# Altium schematic sheet Keyboard.SchDoc
size C
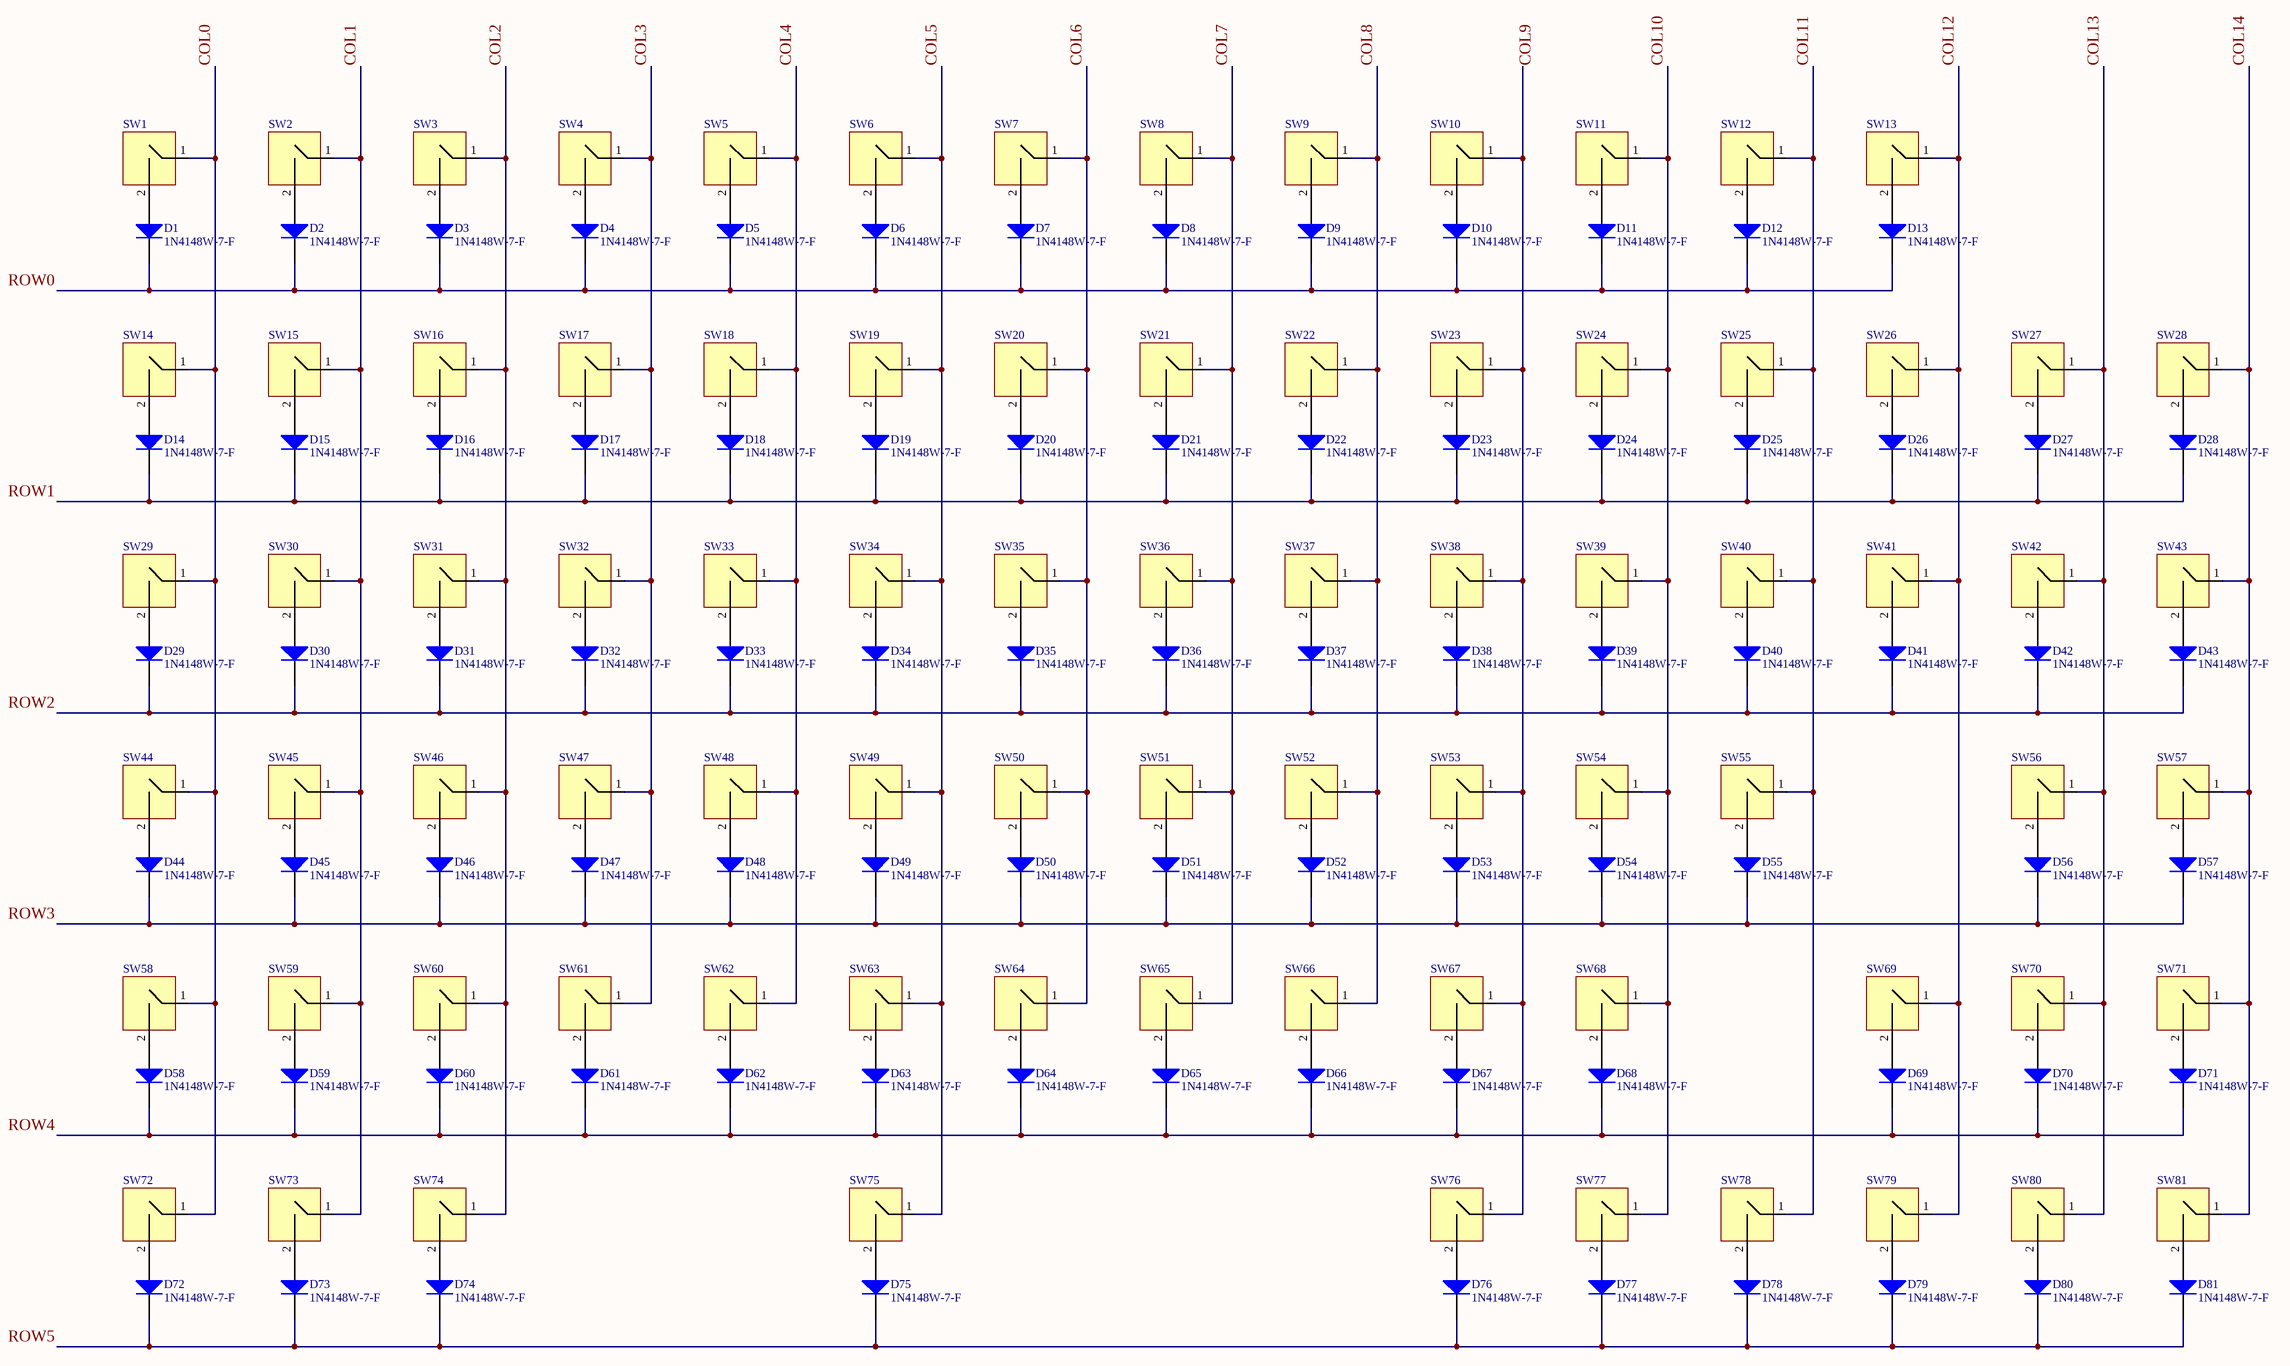
[diagram p0: Keyboard.SchDoc]

## Parts
D1  1N4148W-7-F  [DIOD-SOD123-2_V]
D2  1N4148W-7-F  [DIOD-SOD123-2_V]
D3  1N4148W-7-F  [DIOD-SOD123-2_V]
D4  1N4148W-7-F  [DIOD-SOD123-2_V]
D5  1N4148W-7-F  [DIOD-SOD123-2_V]
D6  1N4148W-7-F  [DIOD-SOD123-2_V]
D7  1N4148W-7-F  [DIOD-SOD123-2_V]
D8  1N4148W-7-F  [DIOD-SOD123-2_V]
D9  1N4148W-7-F  [DIOD-SOD123-2_V]
D10  1N4148W-7-F  [DIOD-SOD123-2_V]
D11  1N4148W-7-F  [DIOD-SOD123-2_V]
D12  1N4148W-7-F  [DIOD-SOD123-2_V]
D13  1N4148W-7-F  [DIOD-SOD123-2_V]
D14  1N4148W-7-F  [DIOD-SOD123-2_V]
D15  1N4148W-7-F  [DIOD-SOD123-2_V]
D16  1N4148W-7-F  [DIOD-SOD123-2_V]
D17  1N4148W-7-F  [DIOD-SOD123-2_V]
D18  1N4148W-7-F  [DIOD-SOD123-2_V]
D19  1N4148W-7-F  [DIOD-SOD123-2_V]
D20  1N4148W-7-F  [DIOD-SOD123-2_V]
D21  1N4148W-7-F  [DIOD-SOD123-2_V]
D22  1N4148W-7-F  [DIOD-SOD123-2_V]
D23  1N4148W-7-F  [DIOD-SOD123-2_V]
D24  1N4148W-7-F  [DIOD-SOD123-2_V]
D25  1N4148W-7-F  [DIOD-SOD123-2_V]
D26  1N4148W-7-F  [DIOD-SOD123-2_V]
D27  1N4148W-7-F  [DIOD-SOD123-2_V]
D28  1N4148W-7-F  [DIOD-SOD123-2_V]
D29  1N4148W-7-F  [DIOD-SOD123-2_V]
D30  1N4148W-7-F  [DIOD-SOD123-2_V]
D31  1N4148W-7-F  [DIOD-SOD123-2_V]
D32  1N4148W-7-F  [DIOD-SOD123-2_V]
D33  1N4148W-7-F  [DIOD-SOD123-2_V]
D34  1N4148W-7-F  [DIOD-SOD123-2_V]
D35  1N4148W-7-F  [DIOD-SOD123-2_V]
D36  1N4148W-7-F  [DIOD-SOD123-2_V]
D37  1N4148W-7-F  [DIOD-SOD123-2_V]
D38  1N4148W-7-F  [DIOD-SOD123-2_V]
D39  1N4148W-7-F  [DIOD-SOD123-2_V]
D40  1N4148W-7-F  [DIOD-SOD123-2_V]
D41  1N4148W-7-F  [DIOD-SOD123-2_V]
D42  1N4148W-7-F  [DIOD-SOD123-2_V]
D43  1N4148W-7-F  [DIOD-SOD123-2_V]
D44  1N4148W-7-F  [DIOD-SOD123-2_V]
D45  1N4148W-7-F  [DIOD-SOD123-2_V]
D46  1N4148W-7-F  [DIOD-SOD123-2_V]
D47  1N4148W-7-F  [DIOD-SOD123-2_V]
D48  1N4148W-7-F  [DIOD-SOD123-2_V]
D49  1N4148W-7-F  [DIOD-SOD123-2_V]
D50  1N4148W-7-F  [DIOD-SOD123-2_V]
D51  1N4148W-7-F  [DIOD-SOD123-2_V]
D52  1N4148W-7-F  [DIOD-SOD123-2_V]
D53  1N4148W-7-F  [DIOD-SOD123-2_V]
D54  1N4148W-7-F  [DIOD-SOD123-2_V]
D55  1N4148W-7-F  [DIOD-SOD123-2_V]
D56  1N4148W-7-F  [DIOD-SOD123-2_V]
D57  1N4148W-7-F  [DIOD-SOD123-2_V]
D58  1N4148W-7-F  [DIOD-SOD123-2_V]
D59  1N4148W-7-F  [DIOD-SOD123-2_V]
D60  1N4148W-7-F  [DIOD-SOD123-2_V]
D61  1N4148W-7-F  [DIOD-SOD123-2_V]
D62  1N4148W-7-F  [DIOD-SOD123-2_V]
D63  1N4148W-7-F  [DIOD-SOD123-2_V]
D64  1N4148W-7-F  [DIOD-SOD123-2_V]
D65  1N4148W-7-F  [DIOD-SOD123-2_V]
D66  1N4148W-7-F  [DIOD-SOD123-2_V]
D67  1N4148W-7-F  [DIOD-SOD123-2_V]
D68  1N4148W-7-F  [DIOD-SOD123-2_V]
D69  1N4148W-7-F  [DIOD-SOD123-2_V]
D70  1N4148W-7-F  [DIOD-SOD123-2_V]
D71  1N4148W-7-F  [DIOD-SOD123-2_V]
D72  1N4148W-7-F  [DIOD-SOD123-2_V]
D73  1N4148W-7-F  [DIOD-SOD123-2_V]
D74  1N4148W-7-F  [DIOD-SOD123-2_V]
D75  1N4148W-7-F  [DIOD-SOD123-2_V]
D76  1N4148W-7-F  [DIOD-SOD123-2_V]
D77  1N4148W-7-F  [DIOD-SOD123-2_V]
D78  1N4148W-7-F  [DIOD-SOD123-2_V]
D79  1N4148W-7-F  [DIOD-SOD123-2_V]
D80  1N4148W-7-F  [DIOD-SOD123-2_V]
D81  1N4148W-7-F  [DIOD-SOD123-2_V]
SW1  Outemu_Switch  [SW_Cherry_MX_PCB_1.00u]  (value not drawn)
SW2  Outemu_Switch  [SW_Cherry_MX_PCB_1.00u]  (value not drawn)
SW3  Outemu_Switch  [SW_Cherry_MX_PCB_1.00u]  (value not drawn)
SW4  Outemu_Switch  [SW_Cherry_MX_PCB_1.00u]  (value not drawn)
SW5  Outemu_Switch  [SW_Cherry_MX_PCB_1.00u]  (value not drawn)
SW6  Outemu_Switch  [SW_Cherry_MX_PCB_1.00u]  (value not drawn)
SW7  Outemu_Switch  [SW_Cherry_MX_PCB_1.00u]  (value not drawn)
SW8  Outemu_Switch  [SW_Cherry_MX_PCB_1.00u]  (value not drawn)
SW9  Outemu_Switch  [SW_Cherry_MX_PCB_1.00u]  (value not drawn)
SW10  Outemu_Switch  [SW_Cherry_MX_PCB_1.00u]  (value not drawn)
SW11  Outemu_Switch  [SW_Cherry_MX_PCB_1.00u]  (value not drawn)
SW12  Outemu_Switch  [SW_Cherry_MX_PCB_1.00u]  (value not drawn)
SW13  Outemu_Switch  [SW_Cherry_MX_PCB_1.00u]  (value not drawn)
SW14  Outemu_Switch  [SW_Cherry_MX_PCB_1.00u]  (value not drawn)
SW15  Outemu_Switch  [SW_Cherry_MX_PCB_1.00u]  (value not drawn)
SW16  Outemu_Switch  [SW_Cherry_MX_PCB_1.00u]  (value not drawn)
SW17  Outemu_Switch  [SW_Cherry_MX_PCB_1.00u]  (value not drawn)
SW18  Outemu_Switch  [SW_Cherry_MX_PCB_1.00u]  (value not drawn)
SW19  Outemu_Switch  [SW_Cherry_MX_PCB_1.00u]  (value not drawn)
SW20  Outemu_Switch  [SW_Cherry_MX_PCB_1.00u]  (value not drawn)
SW21  Outemu_Switch  [SW_Cherry_MX_PCB_1.00u]  (value not drawn)
SW22  Outemu_Switch  [SW_Cherry_MX_PCB_1.00u]  (value not drawn)
SW23  Outemu_Switch  [SW_Cherry_MX_PCB_1.00u]  (value not drawn)
SW24  Outemu_Switch  [SW_Cherry_MX_PCB_1.00u]  (value not drawn)
SW25  Outemu_Switch  [SW_Cherry_MX_PCB_1.00u]  (value not drawn)
SW26  Outemu_Switch  [SW_Cherry_MX_PCB_1.00u]  (value not drawn)
SW27  Outemu_Switch  [SW_Cherry_MX_PCB_1.00u]  (value not drawn)
SW28  Outemu_Switch  [SW_Cherry_MX_PCB_1.00u]  (value not drawn)
SW29  Outemu_Switch  [SW_Cherry_MX_PCB_1.00u]  (value not drawn)
SW30  Outemu_Switch  [SW_Cherry_MX_PCB_1.00u]  (value not drawn)
SW31  Outemu_Switch  [SW_Cherry_MX_PCB_1.00u]  (value not drawn)
SW32  Outemu_Switch  [SW_Cherry_MX_PCB_1.00u]  (value not drawn)
SW33  Outemu_Switch  [SW_Cherry_MX_PCB_1.00u]  (value not drawn)
SW34  Outemu_Switch  [SW_Cherry_MX_PCB_1.00u]  (value not drawn)
SW35  Outemu_Switch  [SW_Cherry_MX_PCB_1.00u]  (value not drawn)
SW36  Outemu_Switch  [SW_Cherry_MX_PCB_1.00u]  (value not drawn)
SW37  Outemu_Switch  [SW_Cherry_MX_PCB_1.00u]  (value not drawn)
SW38  Outemu_Switch  [SW_Cherry_MX_PCB_1.00u]  (value not drawn)
SW39  Outemu_Switch  [SW_Cherry_MX_PCB_1.00u]  (value not drawn)
SW40  Outemu_Switch  [SW_Cherry_MX_PCB_1.00u]  (value not drawn)
SW41  Outemu_Switch  [SW_Cherry_MX_PCB_1.00u]  (value not drawn)
SW42  Outemu_Switch  [SW_Cherry_MX_PCB_1.00u]  (value not drawn)
SW43  Outemu_Switch  [SW_Cherry_MX_PCB_1.00u]  (value not drawn)
SW44  Outemu_Switch  [SW_Cherry_MX_PCB_1.00u]  (value not drawn)
SW45  Outemu_Switch  [SW_Cherry_MX_PCB_1.00u]  (value not drawn)
SW46  Outemu_Switch  [SW_Cherry_MX_PCB_1.00u]  (value not drawn)
SW47  Outemu_Switch  [SW_Cherry_MX_PCB_1.00u]  (value not drawn)
SW48  Outemu_Switch  [SW_Cherry_MX_PCB_1.00u]  (value not drawn)
SW49  Outemu_Switch  [SW_Cherry_MX_PCB_1.00u]  (value not drawn)
SW50  Outemu_Switch  [SW_Cherry_MX_PCB_1.00u]  (value not drawn)
SW51  Outemu_Switch  [SW_Cherry_MX_PCB_1.00u]  (value not drawn)
SW52  Outemu_Switch  [SW_Cherry_MX_PCB_1.00u]  (value not drawn)
SW53  Outemu_Switch  [SW_Cherry_MX_PCB_1.00u]  (value not drawn)
SW54  Outemu_Switch  [SW_Cherry_MX_PCB_1.00u]  (value not drawn)
SW55  Outemu_Switch  [SW_Cherry_MX_PCB_1.00u]  (value not drawn)
SW56  Outemu_Switch  [SW_Cherry_MX_PCB_1.00u]  (value not drawn)
SW57  Outemu_Switch  [SW_Cherry_MX_PCB_1.00u]  (value not drawn)
SW58  Outemu_Switch  [SW_Cherry_MX_PCB_1.00u]  (value not drawn)
SW59  Outemu_Switch  [SW_Cherry_MX_PCB_1.00u]  (value not drawn)
SW60  Outemu_Switch  [SW_Cherry_MX_PCB_1.00u]  (value not drawn)
SW61  Outemu_Switch  [SW_Cherry_MX_PCB_1.00u]  (value not drawn)
SW62  Outemu_Switch  [SW_Cherry_MX_PCB_1.00u]  (value not drawn)
SW63  Outemu_Switch  [SW_Cherry_MX_PCB_1.00u]  (value not drawn)
SW64  Outemu_Switch  [SW_Cherry_MX_PCB_1.00u]  (value not drawn)
SW65  Outemu_Switch  [SW_Cherry_MX_PCB_1.00u]  (value not drawn)
SW66  Outemu_Switch  [SW_Cherry_MX_PCB_1.00u]  (value not drawn)
SW67  Outemu_Switch  [SW_Cherry_MX_PCB_1.00u]  (value not drawn)
SW68  Outemu_Switch  [SW_Cherry_MX_PCB_1.00u]  (value not drawn)
SW69  Outemu_Switch  [SW_Cherry_MX_PCB_1.00u]  (value not drawn)
SW70  Outemu_Switch  [SW_Cherry_MX_PCB_1.00u]  (value not drawn)
SW71  Outemu_Switch  [SW_Cherry_MX_PCB_1.00u]  (value not drawn)
SW72  Outemu_Switch  [SW_Cherry_MX_PCB_1.00u]  (value not drawn)
SW73  Outemu_Switch  [SW_Cherry_MX_PCB_1.00u]  (value not drawn)
SW74  Outemu_Switch  [SW_Cherry_MX_PCB_1.00u]  (value not drawn)
SW75  Outemu_Switch  [SW_Cherry_MX_PCB_1.00u]  (value not drawn)
SW76  Outemu_Switch  [SW_Cherry_MX_PCB_1.00u]  (value not drawn)
SW77  Outemu_Switch  [SW_Cherry_MX_PCB_1.00u]  (value not drawn)
SW78  Outemu_Switch  [SW_Cherry_MX_PCB_1.00u]  (value not drawn)
SW79  Outemu_Switch  [SW_Cherry_MX_PCB_1.00u]  (value not drawn)
SW80  Outemu_Switch  [SW_Cherry_MX_PCB_1.00u]  (value not drawn)
SW81  Outemu_Switch  [SW_Cherry_MX_PCB_1.00u]  (value not drawn)

## Nets
COL0: SW1.1 SW14.1 SW29.1 SW44.1 SW58.1 SW72.1
COL1: SW2.1 SW15.1 SW30.1 SW45.1 SW59.1 SW73.1
COL2: SW3.1 SW16.1 SW31.1 SW46.1 SW60.1 SW74.1
COL3: SW4.1 SW17.1 SW32.1 SW47.1 SW61.1
COL4: SW5.1 SW18.1 SW33.1 SW48.1 SW62.1
COL5: SW6.1 SW19.1 SW34.1 SW49.1 SW63.1 SW75.1
COL6: SW7.1 SW20.1 SW35.1 SW50.1 SW64.1
COL7: SW8.1 SW21.1 SW36.1 SW51.1 SW65.1
COL8: SW9.1 SW22.1 SW37.1 SW52.1 SW66.1
COL10: SW11.1 SW24.1 SW39.1 SW54.1 SW68.1 SW77.1
COL11: SW12.1 SW25.1 SW40.1 SW55.1 SW78.1
COL12: SW13.1 SW26.1 SW41.1 SW69.1 SW79.1
COL13: SW27.1 SW42.1 SW56.1 SW70.1 SW80.1
COL14: SW28.1 SW43.1 SW57.1 SW71.1 SW81.1
ROW0: D1.2(K) D2.2(K) D3.2(K) D4.2(K) D5.2(K) D6.2(K) D7.2(K) D8.2(K) D9.2(K) D10.2(K) D11.2(K) D12.2(K) D13.2(K)
ROW1: D14.2(K) D15.2(K) D16.2(K) D17.2(K) D18.2(K) D19.2(K) D20.2(K) D21.2(K) D22.2(K) D23.2(K) D24.2(K) D25.2(K) D26.2(K) D27.2(K) D28.2(K)
ROW2: D29.2(K) D30.2(K) D31.2(K) D32.2(K) D33.2(K) D34.2(K) D35.2(K) D36.2(K) D37.2(K) D38.2(K) D39.2(K) D40.2(K) D41.2(K) D42.2(K) D43.2(K)
ROW3: D44.2(K) D45.2(K) D46.2(K) D47.2(K) D48.2(K) D49.2(K) D50.2(K) D51.2(K) D52.2(K) D53.2(K) D54.2(K) D55.2(K) D56.2(K) D57.2(K)
ROW4: D58.2(K) D59.2(K) D60.2(K) D61.2(K) D62.2(K) D63.2(K) D64.2(K) D65.2(K) D66.2(K) D67.2(K) D68.2(K) D69.2(K) D70.2(K) D71.2(K)
ROW5: D72.2(K) D73.2(K) D74.2(K) D75.2(K) D76.2(K) D77.2(K) D78.2(K) D79.2(K) D80.2(K) D81.2(K)
NetD1_1: D1.1(A) SW1.2
NetD2_1: D2.1(A) SW2.2
NetD3_1: D3.1(A) SW3.2
NetD4_1: D4.1(A) SW4.2
NetD5_1: D5.1(A) SW5.2
NetD6_1: D6.1(A) SW6.2
NetD7_1: D7.1(A) SW7.2
NetD8_1: D8.1(A) SW8.2
NetD9_1: D9.1(A) SW9.2
NetD10_1: D10.1(A) SW10.2
NetD11_1: D11.1(A) SW11.2
NetD12_1: D12.1(A) SW12.2
NetD13_1: D13.1(A) SW13.2
NetD14_1: D14.1(A) SW14.2
NetD15_1: D15.1(A) SW15.2
NetD16_1: D16.1(A) SW16.2
NetD17_1: D17.1(A) SW17.2
NetD18_1: D18.1(A) SW18.2
NetD19_1: D19.1(A) SW19.2
NetD20_1: D20.1(A) SW20.2
NetD21_1: D21.1(A) SW21.2
NetD22_1: D22.1(A) SW22.2
NetD23_1: D23.1(A) SW23.2
NetD24_1: D24.1(A) SW24.2
NetD25_1: D25.1(A) SW25.2
NetD26_1: D26.1(A) SW26.2
NetD27_1: D27.1(A) SW27.2
NetD28_1: D28.1(A) SW28.2
NetD29_1: D29.1(A) SW29.2
NetD30_1: D30.1(A) SW30.2
NetD31_1: D31.1(A) SW31.2
NetD32_1: D32.1(A) SW32.2
NetD33_1: D33.1(A) SW33.2
NetD34_1: D34.1(A) SW34.2
NetD35_1: D35.1(A) SW35.2
NetD36_1: D36.1(A) SW36.2
NetD37_1: D37.1(A) SW37.2
NetD38_1: D38.1(A) SW38.2
NetD39_1: D39.1(A) SW39.2
NetD40_1: D40.1(A) SW40.2
NetD41_1: D41.1(A) SW41.2
NetD42_1: D42.1(A) SW42.2
NetD43_1: D43.1(A) SW43.2
NetD44_1: D44.1(A) SW44.2
NetD45_1: D45.1(A) SW45.2
NetD46_1: D46.1(A) SW46.2
NetD47_1: D47.1(A) SW47.2
NetD48_1: D48.1(A) SW48.2
NetD49_1: D49.1(A) SW49.2
NetD50_1: D50.1(A) SW50.2
NetD51_1: D51.1(A) SW51.2
NetD52_1: D52.1(A) SW52.2
NetD53_1: D53.1(A) SW53.2
NetD54_1: D54.1(A) SW54.2
NetD55_1: D55.1(A) SW55.2
NetD56_1: D56.1(A) SW56.2
NetD57_1: D57.1(A) SW57.2
NetD58_1: D58.1(A) SW58.2
NetD59_1: D59.1(A) SW59.2
NetD60_1: D60.1(A) SW60.2
NetD61_1: D61.1(A) SW61.2
NetD62_1: D62.1(A) SW62.2
NetD63_1: D63.1(A) SW63.2
NetD64_1: D64.1(A) SW64.2
NetD65_1: D65.1(A) SW65.2
NetD66_1: D66.1(A) SW66.2
NetD67_1: D67.1(A) SW67.2
NetD68_1: D68.1(A) SW68.2
NetD69_1: D69.1(A) SW69.2
NetD70_1: D70.1(A) SW70.2
NetD71_1: D71.1(A) SW71.2
NetD72_1: D72.1(A) SW72.2
NetD73_1: D73.1(A) SW73.2
NetD74_1: D74.1(A) SW74.2
NetD75_1: D75.1(A) SW75.2
NetD76_1: D76.1(A) SW76.2
NetD77_1: D77.1(A) SW77.2
NetD78_1: D78.1(A) SW78.2
NetD79_1: D79.1(A) SW79.2
NetD80_1: D80.1(A) SW80.2
NetD81_1: D81.1(A) SW81.2
NetSW10_1: SW10.1 SW23.1 SW38.1 SW53.1 SW67.1 SW76.1

## Notes on the sheet
- Labels drawn without touching a wire or pin: COL9

## Library data of the parts
D1-D81 = CMP-2000-04932-2: Fast Switching Diode, 100 V, 0.15 A, -65 to 150 degC, 2-Pin?SOD123, RoHS, Tape and Reel; Recovery Time: 4ns; Brand: DiodesIncorporated; Unit Weight: 0.000353oz; Max Surge Current: 2A; Peak Reverse Voltage: 100V; Ir - Reverse Current: 1uA; Vf - Forward Voltage: 1.25V; Configuration: Single; If - Forward Current: 0.15A; Product Category: Diodes-GeneralPurpose,Power,Switching; Operating Temperature Range: -65Cto+150C; Packaging: Reel; Manufacturer URL: http://www.diodes.com/; Maximum Operating Temperature: +150C; Height: 1.25mm; Minimum Operating Temperature: -65C; Product: SwitchingDiodes; Package URL: http://www.diodes.com/datasheets/ds18004.pdf; Type: SwitchingDiode; Package Reference: SOD123-2; Width: 1.7mm; Datasheet URL: http://www.farnell.com/datasheets/1915529.pdf; Datasheet Version: Rev. 24-2, 10/2013; Series: 1N4148; Factory Pack Quantity: 3000; Length: 2.85mm; RoHS: True; Manufacturer: DiodesIncorporated; Mounting Style: SMD/SMT; Package / Case: SOD-123